# Altium schematic sheet Sheet_1_2023-02-22.schdoc
size 182 x 100 mm
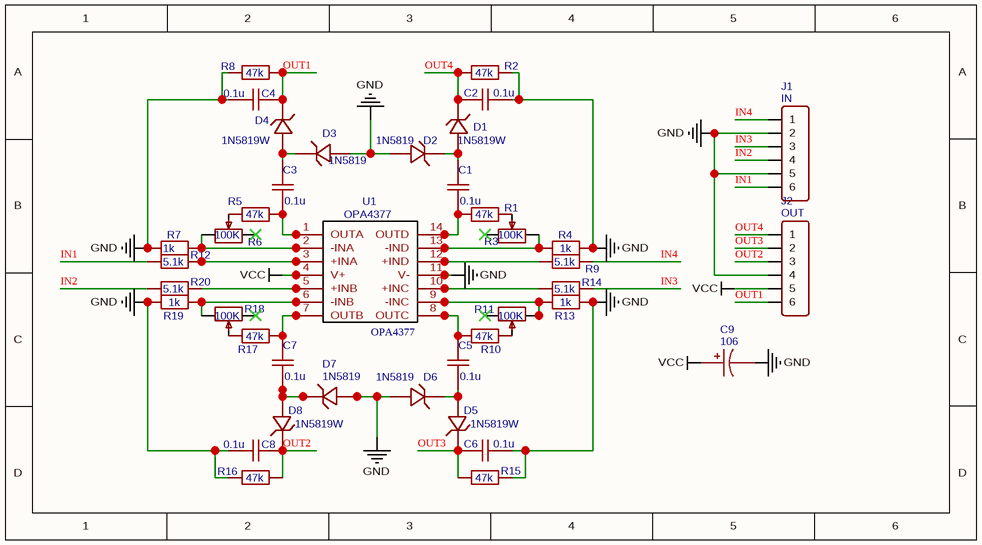
[diagram p0: Sheet_1_2023-02-22.schdoc]

## Parts
C1  0.1u  [C0805]
C2  0.1u  [C0805]
C3  0.1u  [C0805]
C4  0.1u  [C0805]
C5  0.1u  [C0805]
C6  0.1u  [C0805]
C7  0.1u  [C0805]
C8  0.1u  [C0805]
C9  106  [CASE-A_3216]
D1  1N5819W  [SOD-123_L2.8-W1.8-LS3.7-RD]
D2  1N5819  [SOD-123_L2.8-W1.8-LS3.7-RD]
D3  1N5819  [SOD-123_L2.8-W1.8-LS3.7-RD]
D4  1N5819W  [SOD-123_L2.8-W1.8-LS3.7-RD]
D5  1N5819W  [SOD-123_L2.8-W1.8-LS3.7-RD]
D6  1N5819  [SOD-123_L2.8-W1.8-LS3.7-RD]
D7  1N5819  [SOD-123_L2.8-W1.8-LS3.7-RD]
D8  1N5819W  [SOD-123_L2.8-W1.8-LS3.7-RD]
J1  IN  [HDR-M-2.54_1X6]
J2  OUT  [HDR-M-2.54_1X6]
R1  47k  [R0805]
R2  47k  [R0805]
R3  100K  [RES-ADJ-TH_3296W]
R4  1k  [R0805]
R5  47k  [R0805]
R6  100K  [RES-ADJ-TH_3296W]
R7  1k  [R0805]
R8  47k  [R0805]
R9  5.1k  [R0805]
R10  47k  [R0805]
R11  100K  [RES-ADJ-TH_3296W]
R12  5.1k  [R0805]
R13  1k  [R0805]
R14  5.1k  [R0805]
R15  47k  [R0805]
R16  47k  [R0805]
R17  47k  [R0805]
R18  100K  [RES-ADJ-TH_3296W]
R19  1k  [R0805]
R20  5.1k  [R0805]
U1  OPA4377  [OPA4377]

## Nets
GND: C2.1 C4.2 C6.1 C8.2 C9.2 D2.2(A) D3.2(A) D6.2(A) D7.2(A) J1.2 J1.5 J2.4 R2.2 R4.2 R7.1 R8.1 R13.2 R15.2 R16.1 R19.1 U1.11(V-)
VCC: C9.1 J2.5 U1.4(V+)
IN1: J1.6 R12.1
IN2: J1.4 R20.1
IN3: J1.3 R14.2
IN4: J1.1 R9.2
OUT1: C4.1 D4.1(C) J2.6 R8.2
OUT2: C8.1 D8.1(C) J2.3 R16.2
OUT3: C6.2 D5.1(C) J2.2 R15.1
OUT4: C2.2 D1.1(C) J2.1 R2.1
NetC1_1: C1.1 R1.1 U1.14(OUTD)
NetC1_2: C1.2 D1.2(A) D2.1(C)
NetC3_1: C3.1 R5.2 U1.1(OUTA)
NetC3_2: C3.2 D3.1(C) D4.2(A)
NetC5_1: C5.1 D5.2(A) D6.1(C)
NetC5_2: C5.2 R10.1 U1.8(OUTC)
NetC7_1: C7.1 D7.1(C) D8.2(A)
NetC7_2: C7.2 R17.2 U1.7(OUTB)
NetR1_2: R1.2 R3.2
NetR3_1: R3.1 R4.1 U1.13(-IND)
NetR5_1: R5.1 R6.2
NetR6_3: R6.3 R7.2 U1.2(-INA)
NetR9_1: R9.1 U1.12(+IND)
NetR10_2: R10.2 R11.2
NetR11_3: R11.3 R13.1 U1.9(-INC)
NetR12_2: R12.2 U1.3(+INA)
NetR14_1: R14.1 U1.10(+INC)
NetR17_1: R17.1 R18.2
NetR18_1: R18.1 R19.2 U1.6(-INB)
NetR20_2: R20.2 U1.5(+INB)

Not connected (* = marked no-connect by the designer): R3 3*; R6 1*; R11 1*; R18 3*

## Library data of the parts
C1-C8 = 0.1u: BOM_Manufacturer Part: 0805F104M500NT; BOM_Manufacturer: FH; nameAlias: Value(F); Contributor: LCEDA_Lib; BOM_Supplier Part: C28378; BOM_Supplier: LCSC; spicePre: C; spiceSymbolName: C_0805_US
C9 = 106: BOM_Manufacturer Part: 210S-1*6P L=11.6MMGold-plated black; BOM_Manufacturer: Ckmtw; nameAlias: Value(F); Contributor: LCEDA_Lib; BOM_Supplier Part: C124380; BOM_Supplier: LCSC; spicePre: C; spiceSymbolName: C_Tan_SMD_A_US
D1 D4 D5 D8 = 1N5819W: BOM_Manufacturer: LGE; Contributor: LCSC; SMT Type: Extend; BOM_Supplier: LCSC; BOM_Supplier Part: C402219; BOM_Manufacturer Part: 1N5819W; BOM_LCSC Assembly: Yes; spicePre: D; spiceSymbolName: 1N5819W_C402219
D2 D3 D6 D7 = 1N5819: BOM_Manufacturer: LGE; BOM_Manufacturer Part: 1N5819W; Contributor: LCSC; SMT Type: Extend; BOM_Supplier: LCSC; BOM_Supplier Part: C402219; BOM_LCSC Assembly: Yes; spicePre: D; spiceSymbolName: 1N5819W_C402219
J1 = IN: BOM_Manufacturer: Ckmtw; BOM_Manufacturer Part: 210S-1*6P L=11.6MMGold-plated black; Contributor: LCEDA_Lib; BOM_Supplier Part: C124380; BOM_Supplier: LCSC; spicePre: J; spiceSymbolName: HDR-M-2.54_1x6
J2 = OUT: Contributor: LCEDA_Lib; BOM_Supplier Part: C190819; BOM_Supplier: LCSC; spicePre: J; spiceSymbolName: HDR-M-2.54_1x6
R1 R2 R5 R8 R10 R15-R17 = 47k: BOM_Manufacturer Part: AECR0805F47K0K9; BOM_Manufacturer: ResistorToday; nameAlias: Value(Ω); Contributor: LCEDA_Lib; BOM_Supplier Part: C328397; BOM_Supplier: LCSC; spicePre: R; spiceSymbolName: R_0805_EU
R3 R6 R11 R18 = 100K: BOM_Manufacturer: Chengdu Guosheng Tech; BOM_Manufacturer Part: 3296W-1-104; nameAlias: Resistance (Ohms); Contributor: LCSC; BOM_Supplier: LCSC; BOM_Supplier Part: C330435; Resistance(Ohms): 100K; spicePre: R; spiceSymbolName: 3296W-1-104_C330435
R4 R7 R13 R19 = 1k: BOM_Manufacturer Part: 0805W8F1001T5E; BOM_Manufacturer: UniOhm; nameAlias: Value(Ω); Contributor: LCEDA_Lib; BOM_Supplier Part: C17513; BOM_Supplier: LCSC; spicePre: R; spiceSymbolName: R_0805_EU
R9 R12 R14 R20 = 5.1k: BOM_Manufacturer Part: 0805W8D5101T5E; BOM_Manufacturer: Uniroyal Elec; nameAlias: Value(Ω); Contributor: LCEDA_Lib; BOM_Supplier Part: C422827; BOM_Supplier: LCSC; spicePre: R; spiceSymbolName: R_0805_EU
U1 = OPA4377: BOM_Manufacturer: OPA4377AIPWR; Contributor: Sirius214; BOM_Supplier: LCSC; BOM_Supplier Part: C130012; spicePre: U; spiceSymbolName: OPA4377